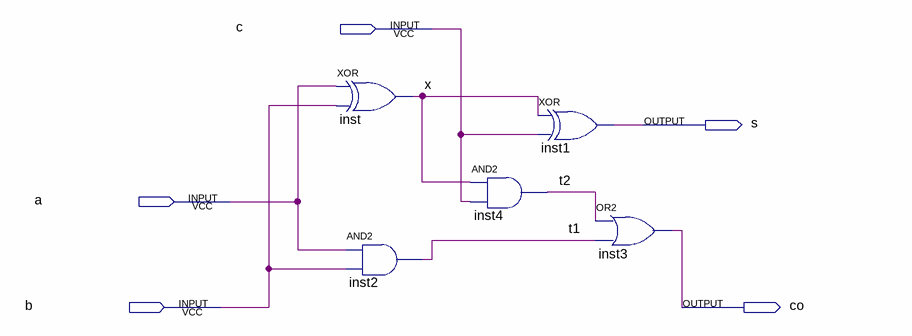
[diagram p0: schematic sheet]
// Quartus schematic FA1.bdf as structural Verilog: 5 symbols, 5 pins
module FA1 (
  input  c,
  input  a,
  input  b,
  output s,
  output co
);

  wire t1, t2, x;

  xor inst (x, a, b);
  and inst2 (t1, a, b);
  and inst4 (t2, x, c);
  xor inst1 (s, x, c);
  or inst3 (co, t2, t1);
endmodule
